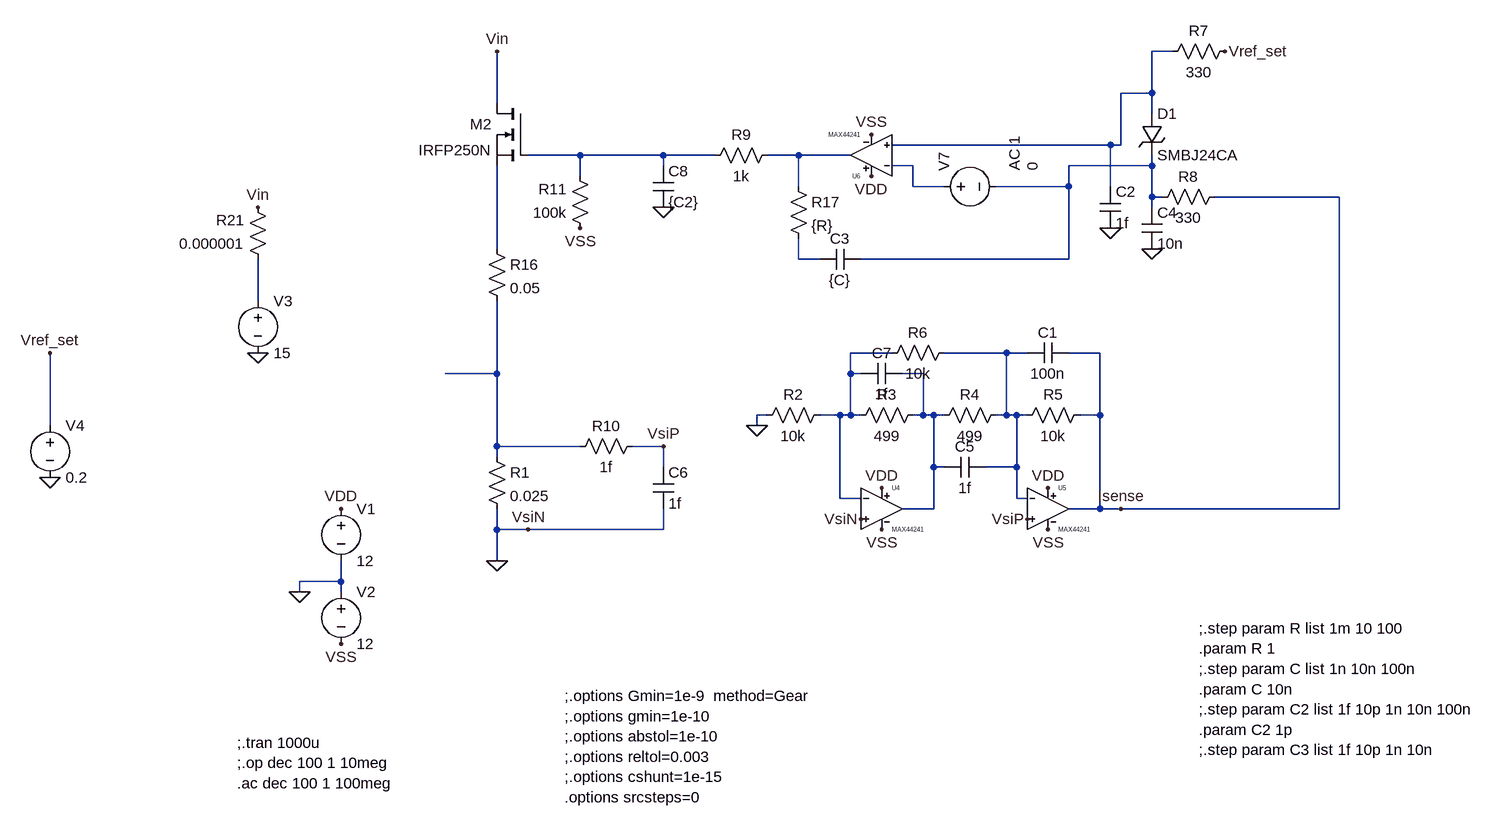
[diagram p0: schematic dc_load_transients_ac_analysis2.asc]
dc_load_transients_ac_analysis2.asc, the LTspice schematic file:
Version 4
SHEET 1 1884 732
WIRE 688 -416 656 -416
WIRE 656 -352 656 -416
WIRE 656 -352 608 -352
WIRE -352 -336 -352 -416
WIRE 656 -320 656 -352
WIRE 592 -272 256 -272
WIRE 608 -272 608 -352
WIRE 608 -272 592 -272
WIRE -224 -256 -304 -256
WIRE -96 -256 -224 -256
WIRE -16 -256 -96 -256
WIRE 112 -256 64 -256
WIRE 192 -256 112 -256
WIRE -96 -240 -96 -256
WIRE 288 -240 256 -240
WIRE 656 -240 656 -256
WIRE 656 -240 528 -240
WIRE -224 -224 -224 -256
WIRE 112 -208 112 -256
WIRE 288 -208 288 -240
WIRE 336 -208 288 -208
WIRE 528 -208 528 -240
WIRE 528 -208 416 -208
WIRE 592 -208 592 -272
WIRE 656 -192 656 -240
WIRE 672 -192 656 -192
WIRE 944 -192 752 -192
WIRE 656 -176 656 -192
WIRE -352 -112 -352 -240
WIRE 112 -96 112 -128
WIRE 144 -96 112 -96
WIRE 528 -96 528 -208
WIRE 528 -96 208 -96
WIRE -720 -32 -720 -96
WIRE 256 48 192 48
WIRE 432 48 336 48
WIRE 464 48 432 48
WIRE 576 48 528 48
WIRE -352 80 -352 -32
WIRE -352 80 -432 80
WIRE 192 80 192 48
WIRE 208 80 192 80
WIRE 304 80 272 80
WIRE 64 144 48 144
WIRE 176 144 144 144
WIRE 192 144 192 80
WIRE 192 144 176 144
WIRE 208 144 192 144
WIRE 304 144 304 80
WIRE 304 144 288 144
WIRE 320 144 304 144
WIRE 336 144 320 144
WIRE 432 144 432 48
WIRE 432 144 416 144
WIRE 448 144 432 144
WIRE 464 144 448 144
WIRE 576 144 576 48
WIRE 576 144 544 144
WIRE -1040 160 -1040 48
WIRE 48 160 48 144
WIRE -352 192 -352 80
WIRE -224 192 -352 192
WIRE -96 192 -144 192
WIRE -352 208 -352 192
WIRE -96 224 -96 192
WIRE 320 224 320 144
WIRE 336 224 320 224
WIRE 448 224 448 144
WIRE 448 224 400 224
WIRE 176 272 176 144
WIRE 208 272 176 272
WIRE 448 272 448 224
WIRE 464 272 448 272
WIRE 320 288 320 224
WIRE 320 288 272 288
WIRE 576 288 576 144
WIRE 576 288 528 288
WIRE 608 288 576 288
WIRE 944 288 944 -192
WIRE 944 288 608 288
WIRE -352 320 -352 288
WIRE -304 320 -352 320
WIRE -96 320 -96 288
WIRE -96 320 -304 320
WIRE -352 368 -352 320
WIRE -592 400 -592 368
WIRE -592 400 -656 400
WIRE -656 416 -656 400
WIRE -592 416 -592 400
FLAG -352 368 0
FLAG -592 288 VDD
FLAG -592 496 VSS
FLAG -656 416 0
FLAG 240 256 VDD
FLAG 496 256 VDD
FLAG 240 320 VSS
FLAG 496 320 VSS
FLAG 48 160 0
FLAG -96 192 VsiP
FLAG 464 304 VsiP
FLAG -304 320 VsiN
FLAG 208 304 VsiN
FLAG 608 288 Isense
FLAG -720 48 0
FLAG -720 -176 Vin
FLAG -1040 48 Vref_set
FLAG -1040 240 0
FLAG 592 -144 0
FLAG 768 -416 Vref_set
FLAG -224 -144 VSS
FLAG -352 -416 Vin
FLAG 224 -224 VDD
FLAG 224 -288 VSS
FLAG 656 -112 0
FLAG -96 -176 0
DATAFLAG -352 80 ""
DATAFLAG -352 -192 ""
DATAFLAG -1040 80 ""
DATAFLAG -352 -400 ""
DATAFLAG -208 -256 ""
DATAFLAG -352 320 ""
DATAFLAG -352 192 ""
DATAFLAG 384 48 ""
DATAFLAG 816 288 ""
DATAFLAG 192 48 ""
DATAFLAG 608 -352 ""
DATAFLAG 512 -96 ""
DATAFLAG 112 -256 ""
DATAFLAG 320 208 ""
SYMBOL res -368 192 R0
SYMATTR InstName R1
SYMATTR Value 0.025
SYMBOL res 160 128 R90
WINDOW 0 0 56 VBottom 2
WINDOW 3 32 56 VTop 2
SYMATTR InstName R2
SYMATTR Value 10k
SYMBOL res 304 128 R90
WINDOW 0 0 56 VBottom 2
WINDOW 3 32 56 VTop 2
SYMATTR InstName R3
SYMATTR Value 499
SYMBOL res 432 128 R90
WINDOW 0 0 56 VBottom 2
WINDOW 3 32 56 VTop 2
SYMATTR InstName R4
SYMATTR Value 499
SYMBOL res 560 128 R90
WINDOW 0 0 56 VBottom 2
WINDOW 3 32 56 VTop 2
SYMATTR InstName R5
SYMATTR Value 10k
SYMBOL res 352 32 R90
WINDOW 0 0 56 VBottom 2
WINDOW 3 32 56 VTop 2
SYMATTR InstName R6
SYMATTR Value 10k
SYMBOL voltage -592 272 R0
WINDOW 123 0 0 Left 2
WINDOW 39 0 0 Left 2
SYMATTR InstName V1
SYMATTR Value 12
SYMBOL voltage -592 400 R0
WINDOW 123 0 0 Left 2
WINDOW 39 0 0 Left 2
SYMATTR InstName V2
SYMATTR Value 12
SYMBOL voltage -720 -48 R0
WINDOW 123 24 124 Left 2
WINDOW 39 0 0 Left 2
SYMATTR InstName V3
SYMATTR Value 15
SYMBOL voltage -1040 144 R0
WINDOW 123 0 0 Left 2
WINDOW 39 0 0 Left 2
SYMATTR InstName V4
SYMATTR Value 0.2
SYMBOL res 784 -432 R90
WINDOW 0 0 56 VBottom 2
WINDOW 3 32 56 VTop 2
SYMATTR InstName R7
SYMATTR Value 330
SYMBOL res 768 -208 R90
WINDOW 0 0 56 VBottom 2
WINDOW 3 32 56 VTop 2
SYMATTR InstName R8
SYMATTR Value 330
SYMBOL cap 576 -208 R0
SYMATTR InstName C2
SYMATTR Value 1f
SYMBOL res 80 -272 R90
WINDOW 0 0 56 VBottom 2
WINDOW 3 32 56 VTop 2
SYMATTR InstName R9
SYMATTR Value 1k
SYMBOL res -208 -128 R180
WINDOW 0 36 76 Left 2
WINDOW 3 36 40 Left 2
SYMATTR InstName R11
SYMATTR Value 100k
SYMBOL nmos -304 -336 M0
SYMATTR InstName M2
SYMATTR Value IRFP250N
SYMBOL cap 528 32 R90
WINDOW 0 0 32 VBottom 2
WINDOW 3 32 32 VTop 2
SYMATTR InstName C1
SYMATTR Value 100n
SYMATTR SpiceLine Rser=5m
SYMBOL cap 208 -112 R90
WINDOW 0 0 32 VBottom 2
WINDOW 3 32 32 VTop 2
SYMATTR InstName C3
SYMATTR Value {C}
SYMATTR SpiceLine Rser=5m
SYMBOL res -368 -128 R0
SYMATTR InstName R16
SYMATTR Value 0.05
SYMBOL res -704 -80 R180
WINDOW 0 36 76 Left 2
WINDOW 3 36 40 Left 2
SYMATTR InstName R21
SYMATTR Value 0.000001
SYMBOL res 96 -224 R0
SYMATTR InstName R17
SYMATTR Value {R}
SYMBOL voltage 320 -208 R270
WINDOW 123 24 124 Left 2
WINDOW 39 0 0 Left 0
WINDOW 3 24 152 Left 2
SYMATTR Value2 AC 1
SYMATTR Value 0
SYMATTR InstName V7
SYMBOL TVSdiode 640 -320 R0
SYMATTR InstName D1
SYMATTR Value SMBJ24CA
SYMBOL MAX44241 240 224 R0
SYMATTR InstName U4
SYMBOL MAX44241 496 224 R0
SYMATTR InstName U5
SYMBOL MAX44241 224 -192 R180
SYMATTR InstName U6
SYMBOL cap 640 -176 R0
SYMATTR InstName C4
SYMATTR Value 10n
SYMATTR SpiceLine Rser=5m
SYMBOL cap 400 208 R90
WINDOW 0 0 32 VBottom 2
WINDOW 3 32 32 VTop 2
SYMATTR InstName C5
SYMATTR Value 1f
SYMBOL cap -112 224 R0
SYMATTR InstName C6
SYMATTR Value 1f
SYMBOL cap 272 64 R90
WINDOW 0 0 32 VBottom 2
WINDOW 3 32 32 VTop 2
SYMATTR InstName C7
SYMATTR Value 1f
SYMBOL cap -112 -240 R0
SYMATTR InstName C8
SYMATTR Value {C2}
SYMBOL res -128 176 R90
WINDOW 0 0 56 VBottom 2
WINDOW 3 32 56 VTop 2
SYMATTR InstName R10
SYMATTR Value 1f
TEXT -752 648 Left 2 !;.tran 1000u\n;.op dec 100 1 10meg\n.ac dec 100 1 100meg
TEXT -248 576 Left 2 !;.options Gmin=1e-9  method=Gear\n;.options gmin=1e-10\n;.options abstol=1e-10\n;.options reltol=0.003\n;.options cshunt=1e-15\n.options srcsteps=0
TEXT 728 472 Left 2 !;.step param R list 1m 10 100\n.param R 1\n;.step param C list 1n 10n 100n\n.param C 10n\n;.step param C2 list 1f 10p 1n 10n 100n\n.param C2 1p\n;.step param C3 list 1f 10p 1n 10n

The netlist it stands for:
* dc_load_transients_ac_analysis2.asc
R1 N011 0 0.025
R2 N009 0 10k
R3 N012 N009 499
R4 N010 N012 499
R5 Isense N010 10k
R6 N010 N009 10k
V1 VDD 0 12
V2 0 VSS 12
V3 N008 0 15
V4 Vref_set 0 0.2
R7 Vref_set N001 330
R8 Isense N005 330
C2 N001 0 1f
R9 N003 N002 1k
R11 VSS N002 100k
M2 Vin N002 N006 N006 IRFP250N
C1 Isense N010 100n Rser=5m
C3 N005 N007 {C} Rser=5m
R16 N006 N011 0.05
R21 N008 Vin 0.000001
R17 N003 N007 {R}
V7 N004 N005 0 AC 1
D1 N001 N005 SMBJ24CA
XU4 0 N009 VDD VSS N012 MAX44241  ; pins INA+ INA- VDD VSS OUTA
XU5 VsiP N010 VDD VSS Isense MAX44241  ; pins INA+ INA- VDD VSS OUTA
XU6 N001 N004 VDD VSS N003 MAX44241  ; pins INA+ INA- VDD VSS OUTA
C4 N005 0 10n Rser=5m
C5 N010 N012 1f
C6 VsiP 0 1f
C7 N012 N009 1f
C8 N002 0 {C2}
R10 VsiP N011 1f
.model D D
.lib standard.dio
.model NMOS NMOS
.model PMOS PMOS
.lib standard.mos
;.tran 1000u
;.op dec 100 1 10meg
.ac dec 100 1 100meg
;.options Gmin=1e-9  method=Gear
;.options gmin=1e-10
;.options abstol=1e-10
;.options reltol=0.003
;.options cshunt=1e-15
.options srcsteps=0
;.step param R list 1m 10 100
.param R 1
;.step param C list 1n 10n 100n
.param C 10n
;.step param C2 list 1f 10p 1n 10n 100n
.param C2 1p
;.step param C3 list 1f 10p 1n 10n
.lib MAX44241.lib
.backanno
.end